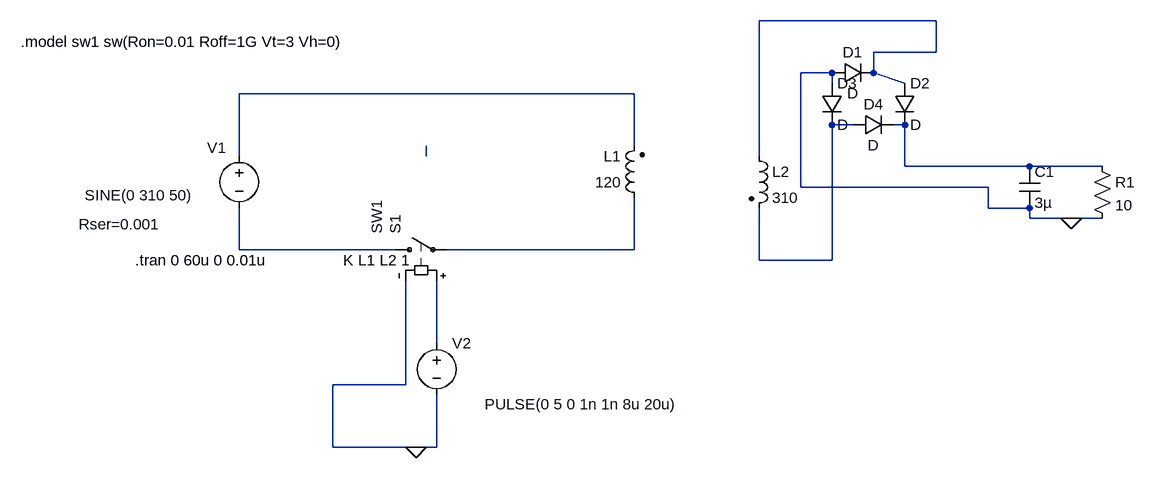
[diagram p0: schematic Draft2.asc]
Draft2.asc, the LTspice schematic file:
Version 4
SHEET 1 1128 680
WIRE 816 -80 544 -80
WIRE 816 -32 816 -80
WIRE 816 -32 720 -32
WIRE 656 0 608 0
WIRE 720 0 720 -32
WIRE 656 16 656 0
WIRE 768 16 720 0
WIRE 352 32 -256 32
WIRE 688 80 656 80
WIRE 768 80 752 80
WIRE 352 112 352 32
WIRE -256 128 -256 32
WIRE 32 128 32 112
WIRE 544 128 544 -80
WIRE 768 144 768 80
WIRE 960 144 768 144
WIRE 1072 144 960 144
WIRE 608 176 608 0
WIRE 896 176 608 176
WIRE 896 208 896 176
WIRE 960 208 896 208
WIRE 960 224 960 208
WIRE 1024 224 960 224
WIRE 1072 224 1024 224
WIRE -256 272 -256 208
WIRE -16 272 -256 272
WIRE 352 272 352 192
WIRE 352 272 64 272
WIRE 544 288 544 208
WIRE 656 288 656 80
WIRE 656 288 544 288
WIRE 48 416 48 320
WIRE 0 480 0 320
WIRE 0 480 -112 480
WIRE -112 576 -112 480
WIRE 16 576 -112 576
WIRE 48 576 48 496
WIRE 48 576 16 576
FLAG 1024 224 0
FLAG 16 576 0
SYMBOL ind2 368 208 R180
WINDOW 0 36 80 Left 2
WINDOW 3 36 40 Left 2
SYMATTR InstName L1
SYMATTR Value 120
SYMATTR Type ind
SYMBOL ind2 528 112 R0
SYMATTR InstName L2
SYMATTR Value 310
SYMATTR Type ind
SYMBOL diode 656 16 R270
WINDOW 0 32 32 VTop 2
WINDOW 3 0 32 VBottom 2
SYMATTR InstName D1
SYMBOL diode 752 16 R0
SYMATTR InstName D2
SYMBOL cap 944 144 R0
SYMATTR InstName C1
SYMATTR Value 3µ
SYMBOL res 1056 128 R0
SYMATTR InstName R1
SYMATTR Value 10
SYMBOL voltage -256 112 R0
WINDOW 0 -49 3 Left 2
WINDOW 3 -238 76 Left 2
WINDOW 123 0 0 Left 0
WINDOW 39 -247 121 Left 2
SYMATTR InstName V1
SYMATTR Value SINE(0 310 50)
SYMATTR SpiceLine Rser=0.001
SYMBOL diode 640 16 R0
SYMATTR InstName D3
SYMBOL diode 688 96 R270
WINDOW 0 32 32 VTop 2
WINDOW 3 0 32 VBottom 2
SYMATTR InstName D4
SYMBOL sw -32 272 R270
WINDOW 3 24 -12 Left 2
SYMATTR Value SW1
SYMATTR InstName S1
SYMBOL voltage 48 400 R0
WINDOW 123 0 0 Left 0
WINDOW 39 0 0 Left 0
WINDOW 3 74 110 Left 2
SYMATTR Value PULSE(0 5 0 1n 1n 8u 20u)
SYMATTR InstName V2
TEXT -416 288 Left 2 !.tran 0 60u 0 0.01u
TEXT -96 288 Left 2 !K L1 L2 1
TEXT -592 -48 Left 2 !.model sw1 sw(Ron=0.01 Roff=1G Vt=3 Vh=0)

The netlist it stands for:
* Draft2.asc
L1 N007 N002 120
L2 N001 N003 310
D1 0 N001 D
D2 N001 N004 D
C1 N004 0 3µ
R1 N004 0 10
V1 N002 N006 SINE(0 310 50) Rser=0.001
D3 0 N003 D
D4 N003 N004 D
S1 N006 N007 N008 0 SW1
V2 N008 0 PULSE(0 5 0 1n 1n 8u 20u)
.model D D
.lib standard.dio
.tran 0 60u 0 0.01u
K L1 L2 1
.model sw1 sw(Ron=0.01 Roff=1G Vt=3 Vh=0)
.backanno
.end